# Altium schematic sheet Alimentacion_Modulos.SchDoc
size A4; SheetNumber: 2; SheetTotal: 3
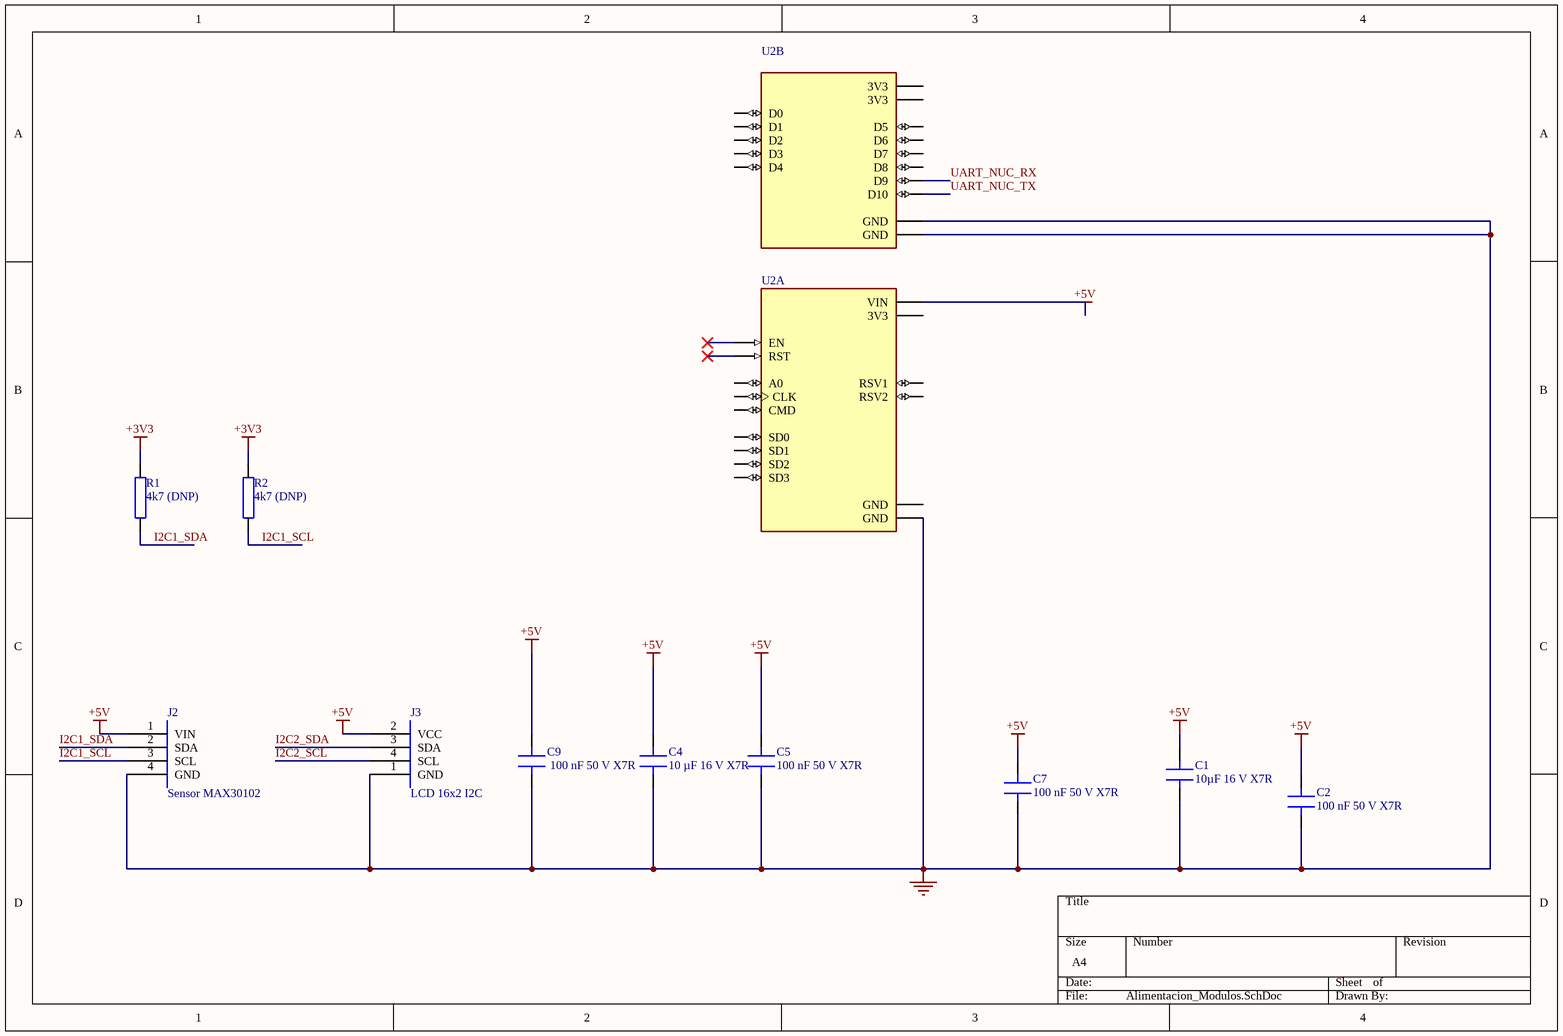
[diagram p0: Alimentacion_Modulos.SchDoc]

## Parts
C1  10µF 16 V X7R  [C0805]
C2  100 nF 50 V X7R  [C0805]
C4  10 µF 16 V X7R  [C0805]
C5  100 nF 50 V X7R  [C0805]
C7  100 nF 50 V X7R  [C0805]
C9  100 nF 50 V X7R  [C0805]
J2  Sensor MAX30102  [CONN_1x4_2.54]
J3  LCD 16x2 I2C  [CONN_1x4_2.54]
R1  4k7 (DNP)  [RES_AXIAL_P400]
R2  4k7 (DNP)  [RES_AXIAL_P400]
U2  (no value)  [SEEED_113990105]  (parts A,B of 2)

## Nets
+3V3: R1.2 R2.2
+5V: C1.1 C2.1 C4.1 C5.1 C7.1 C9.1 J2.1(VIN) J3.2(VCC) U2.J1_15(VIN)
GND: C1.2 C2.2 C4.2 C5.2 C7.2 C9.2 J2.4(GND) J3.1(GND) U2.J1_14(GND) U2.J2_7(GND) U2.J2_14(GND)
I2C1_SCL: J2.3(SCL) R2.1
I2C1_SDA: J2.2(SDA) R1.1
I2C2_SCL: J3.4(SCL)
I2C2_SDA: J3.3(SDA)
UART_NUC_RX: U2.J2_12(D9)
UART_NUC_TX: U2.J2_13(D10)

Not connected (* = marked no-connect by the designer): U2 J1_1(A0) J1_2(RSV1) J1_3(RSV2) J1_4(SD3) J1_5(SD2) J1_6(SD1) J1_7(CMD) J1_8(SD0) J1_9(CLK) J1_10(GND) J1_11(3V3) J1_12(EN)* J1_13(RST)* J2_1(D0) J2_2(D1) J2_3(D2) J2_4(D3) J2_5(D4) J2_6(3V3) J2_8(D5) J2_9(D6) J2_10(D7) J2_11(D8) J2_15(3V3)

## Library data of the parts
C1 C2 C4 C5 C7 C9 = Capacitor: Non polarized capacitor
J2 = CONN_SENSOR_MAX30102: Conector 1x4 para modulo MAX30102 (VIN SDA SCL GND)
J3 = CONN_LCD_I2C: Conector 1x4 para LCD 16x2 con backpack I2C (GND VCC SDA SCL)
R1 R2 = RES: Resistencia
U2 = 113990105: An open-source firmware and development kit that helps you to Prototype your IOT product within a few Lua script lines; MF: Seeed Technology; MP: NodeMCU v2; SnapEDA_Link: https://www.snapeda.com/parts/NodeMCU%20v2/Seeed+Technology+Co.%252C+Ltd/view-part/?ref=snap; Package: None; Value: *; Check_prices: https://www.snapeda.com/parts/NodeMCU%20v2/Seeed+Technology+Co.%252C+Ltd/view-part/?ref=eda